# Altium schematic sheet 300_BUCK_5V.SchDoc: CONVERTIDOR BUCK 5V
size A4; Date: 23/10/2026; DrawnBy: Santiago Londoño; SheetNumber: 3; SheetTotal: 8
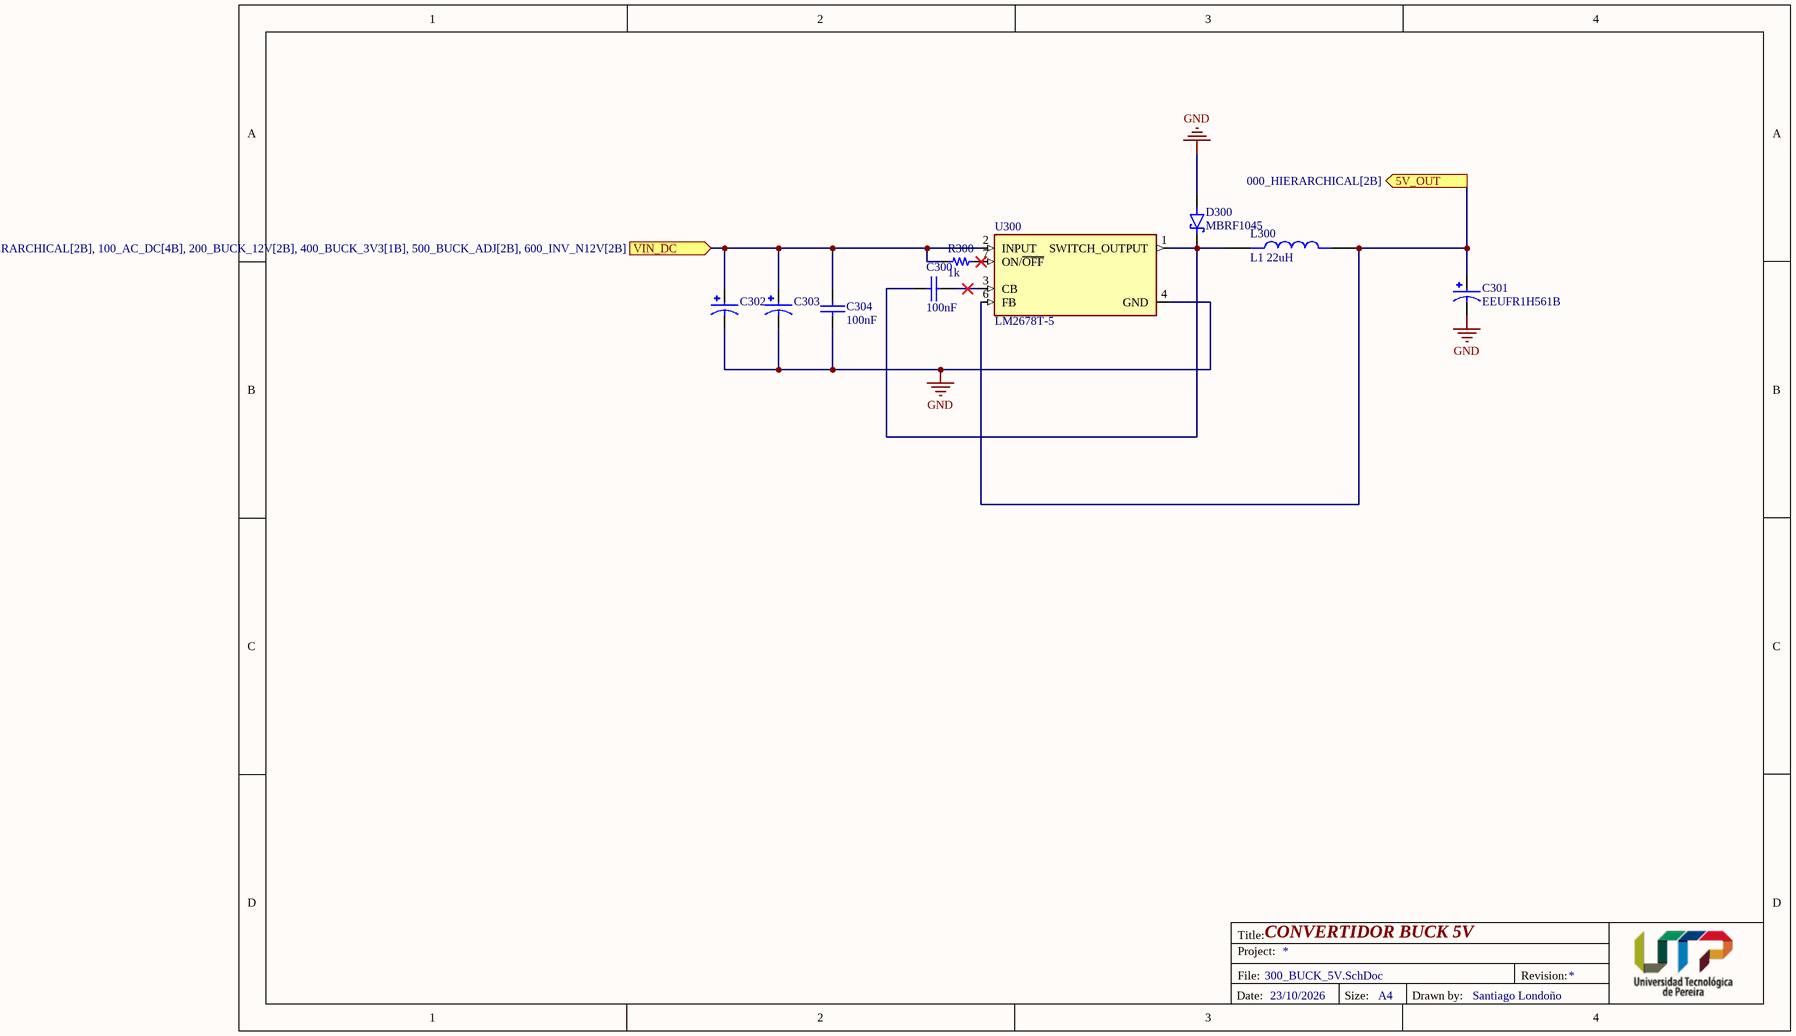
[diagram p0: 300_BUCK_5V.SchDoc]

## Parts
C300  value 100nF  [1206]  (hidden comment: 100nF 100V)
C301  EEUFR1H561B  [CAPPRD500W60D1250H2500]
C302  EEUFR1H561B  [CAPPRD500W60D1250H2500]  (value not drawn)
C303  EEUFR1H561B  [CAPPRD500W60D1250H2500]  (value not drawn)
C304  value 100nF  [1206]  (hidden comment: 100nF 100V)
D300  MBRF1045  [TO508P995X450X1960-2]
L300  L1 22uH  [IND_SER2918H-333KL]
R300  value 1k  [0201]  (hidden comment: 1k 1/20W)
U300  LM2678T-5  [TO127P1041X469X2199-7N]

## Ports
5V_OUT (out, see 000_HIERARCHICAL[2B]), VIN_DC (in, see 000_HIERARCHICAL[2B], 100_AC_DC[4B], 200_BUCK_12V[2B], 400_BUCK_3V3[1B], 500_BUCK_ADJ[2B], 600_INV_N12V[2B])

## Nets
GND: C301.N C302.N C303.N C304.2 D300.2(A) U300.4(GND)
5V_OUT: C301.P L300.2 U300.6(FB) ; port 5V_OUT
VIN_DC: C302.P C303.P C304.1 R300.2 U300.2(INPUT) ; port VIN_DC
NetC300_1: C300.1 D300.1(K) L300.1 U300.1(SWITCH_OUTPUT)
NetC300_2: C300.2 U300.3(CB)
NetR300_1: R300.1 U300.7(ON/~{OFF})

## Notes on the sheet
- Title:
- Project:
- File:
- Revision:
- Date:
- Size:
- A4
- Drawn by:

## Library data of the parts
C300 C304 = Cap_0.1uF_1206_100V: CAP CER 0.1UF 100V X7R 1206; Manufacturer: Samsung Electro-Mechanics; Manufacturer Part Number: CL31B104KCFNNNE; Supplier 1: Digi-Key; Supplier Part Number 1: 1276-1151-1-ND; Last modified by: J.Jaramillo; Last modified date: 20240309; ComponentLink1Description: Digi-Key; ComponentLink1URL: https://www.digikey.com/en/products/detail/samsung-electro-mechanics/CL31B104KCFNNNE/3886809
C301-C303 = EEUFR1H561B: MF: {'manufacturer': u'Panasonic Electronic Components'}; Package: None; Price: None; Value: *; MP: EEUFR1H561B; Availability: Unavailable
L300 = SER2918H-333KL: INDUCTOR, PWR, 33UH, 28A, 0.1, 10MHZ; Product Range:COILCRAFT - SER2900 Series; Inductance:33ÂµH; Inductance Tolerance:Â± 10%; Inductor Construction:Shielded; DC Resistance Max:2860Âµohm; RMS Current (Irms):28A; Saturation Current (Isat):7A; Case Dimensio; SnapEDA_Link: https://www.snapeda.com/parts/SER2918H-333KL/Coilcraft/view-part/?ref=snap; Package: None; Value: *; MF: Coilcraft; MP: SER2918H-333KL; Check_prices: https://www.snapeda.com/parts/SER2918H-333KL/Coilcraft/view-part/?ref=eda
R300 = Res_1k_0201_1/20W: RES 1K OHM 1% 1/20W 0201; Manufacturer: YAGEO; Manufacturer Part Number: RC0201FR-071KL; Supplier 1: Digi-Key; Supplier Part Number 1: 311-1KMCT-ND; Reel Stock: N/A; Last modified by: J.Jaramillo; Last modified date: 20240310; ComponentLink1Description: Digi-Key; ComponentLink1URL: https://www.digikey.com/en/products/detail/yageo/RC0201FR-071KL/3202389?s=N4IgTCBcDaIMwEYEFoEGkCyBhAKsgcgCIgC6AvkA
U300 = LM2678T-ADJ: 8V to 40V, 5A SIMPLE SWITCHER buck converter with high efficiency 7-TO-220 -40 to 125; MF: Texas Instruments; SnapEDA_Link: https://www.snapeda.com/parts/LM2678T-ADJ/Texas+Instruments/view-part/?ref=snap; Package: TO-220-7 Texas Instruments; Value: *; MP: LM2678T-ADJ; Check_prices: https://www.snapeda.com/parts/LM2678T-ADJ/Texas+Instruments/view-part/?ref=eda
D300 = MBRF1045: Availability: Unavailable; Value: *; Package: None; MP: MBRF1045; Price: None